# Altium schematic sheet Flash_memory.SchDoc: =DT_SCH_Title
size A3; Organization: Droid Technologies; SheetNumber: 6; SheetTotal: 22
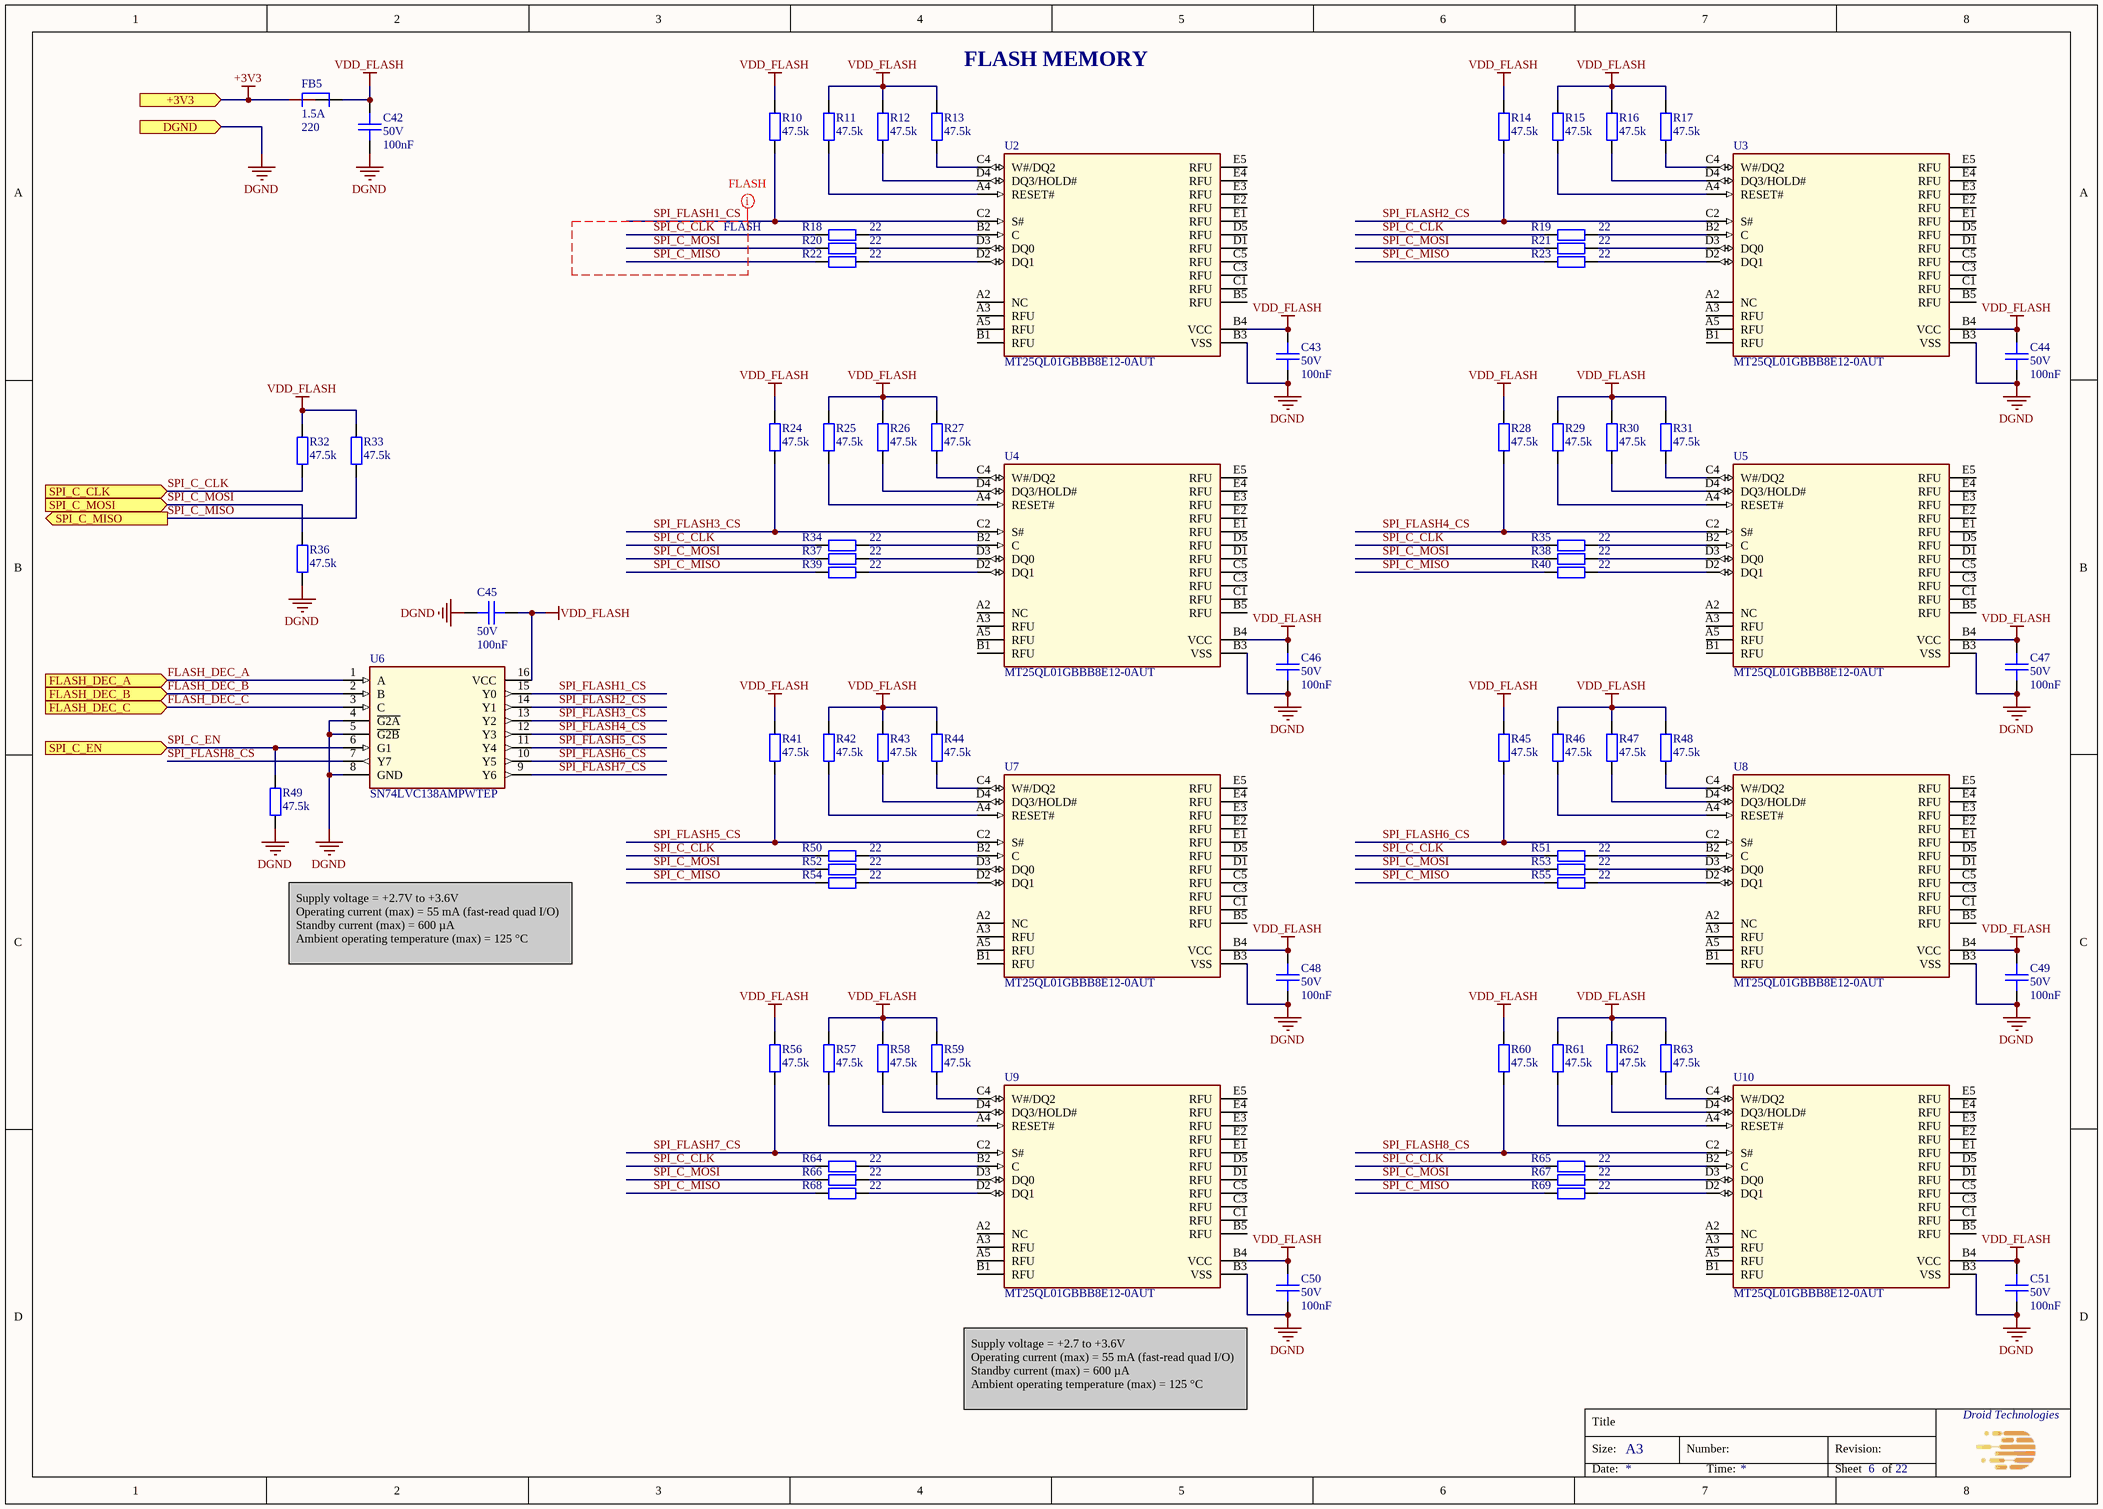
[diagram p0: Flash_memory.SchDoc]

## Parts
C42  Voltage Rating: 50V  Capacitance: 100nF  [CAPC100x50x50L25]  (hidden comment: GCM155L8EH104KE07D)
C43  Voltage Rating: 50V  Capacitance: 100nF  [CAPC100x50x50L25]  (hidden comment: GCM155L8EH104KE07D)
C44  Voltage Rating: 50V  Capacitance: 100nF  [CAPC100x50x50L25]  (hidden comment: GCM155L8EH104KE07D)
C45  Voltage Rating: 50V  Capacitance: 100nF  [CAPC100x50x50L25]  (hidden comment: GCM155L8EH104KE07D)
C46  Voltage Rating: 50V  Capacitance: 100nF  [CAPC100x50x50L25]  (hidden comment: GCM155L8EH104KE07D)
C47  Voltage Rating: 50V  Capacitance: 100nF  [CAPC100x50x50L25]  (hidden comment: GCM155L8EH104KE07D)
C48  Voltage Rating: 50V  Capacitance: 100nF  [CAPC100x50x50L25]  (hidden comment: GCM155L8EH104KE07D)
C49  Voltage Rating: 50V  Capacitance: 100nF  [CAPC100x50x50L25]  (hidden comment: GCM155L8EH104KE07D)
C50  Voltage Rating: 50V  Capacitance: 100nF  [CAPC100x50x50L25]  (hidden comment: GCM155L8EH104KE07D)
C51  Voltage Rating: 50V  Capacitance: 100nF  [CAPC100x50x50L25]  (hidden comment: GCM155L8EH104KE07D)
FB5  Imax: 1.5A  Impedance: 220  [BEADC160X80X95L40]  (hidden comment: BLM18KG221BH1D)
R10  Resistance: 47.5k  [RESC100X50X40L25]  (hidden comment: RC0402FR-0747K5L)
R11  Resistance: 47.5k  [RESC100X50X40L25]  (hidden comment: RC0402FR-0747K5L)
R12  Resistance: 47.5k  [RESC100X50X40L25]  (hidden comment: RC0402FR-0747K5L)
R13  Resistance: 47.5k  [RESC100X50X40L25]  (hidden comment: RC0402FR-0747K5L)
R14  Resistance: 47.5k  [RESC100X50X40L25]  (hidden comment: RC0402FR-0747K5L)
R15  Resistance: 47.5k  [RESC100X50X40L25]  (hidden comment: RC0402FR-0747K5L)
R16  Resistance: 47.5k  [RESC100X50X40L25]  (hidden comment: RC0402FR-0747K5L)
R17  Resistance: 47.5k  [RESC100X50X40L25]  (hidden comment: RC0402FR-0747K5L)
R18  Resistance: 22  [RESC100X50X40L25]  (hidden comment: RC0402FR-0722RL)
R19  Resistance: 22  [RESC100X50X40L25]  (hidden comment: RC0402FR-0722RL)
R20  Resistance: 22  [RESC100X50X40L25]  (hidden comment: RC0402FR-0722RL)
R21  Resistance: 22  [RESC100X50X40L25]  (hidden comment: RC0402FR-0722RL)
R22  Resistance: 22  [RESC100X50X40L25]  (hidden comment: RC0402FR-0722RL)
R23  Resistance: 22  [RESC100X50X40L25]  (hidden comment: RC0402FR-0722RL)
R24  Resistance: 47.5k  [RESC100X50X40L25]  (hidden comment: RC0402FR-0747K5L)
R25  Resistance: 47.5k  [RESC100X50X40L25]  (hidden comment: RC0402FR-0747K5L)
R26  Resistance: 47.5k  [RESC100X50X40L25]  (hidden comment: RC0402FR-0747K5L)
R27  Resistance: 47.5k  [RESC100X50X40L25]  (hidden comment: RC0402FR-0747K5L)
R28  Resistance: 47.5k  [RESC100X50X40L25]  (hidden comment: RC0402FR-0747K5L)
R29  Resistance: 47.5k  [RESC100X50X40L25]  (hidden comment: RC0402FR-0747K5L)
R30  Resistance: 47.5k  [RESC100X50X40L25]  (hidden comment: RC0402FR-0747K5L)
R31  Resistance: 47.5k  [RESC100X50X40L25]  (hidden comment: RC0402FR-0747K5L)
R32  Resistance: 47.5k  [RESC100X50X40L25]  (hidden comment: RC0402FR-0747K5L)
R33  Resistance: 47.5k  [RESC100X50X40L25]  (hidden comment: RC0402FR-0747K5L)
R34  Resistance: 22  [RESC100X50X40L25]  (hidden comment: RC0402FR-0722RL)
R35  Resistance: 22  [RESC100X50X40L25]  (hidden comment: RC0402FR-0722RL)
R36  Resistance: 47.5k  [RESC100X50X40L25]  (hidden comment: RC0402FR-0747K5L)
R37  Resistance: 22  [RESC100X50X40L25]  (hidden comment: RC0402FR-0722RL)
R38  Resistance: 22  [RESC100X50X40L25]  (hidden comment: RC0402FR-0722RL)
R39  Resistance: 22  [RESC100X50X40L25]  (hidden comment: RC0402FR-0722RL)
R40  Resistance: 22  [RESC100X50X40L25]  (hidden comment: RC0402FR-0722RL)
R41  Resistance: 47.5k  [RESC100X50X40L25]  (hidden comment: RC0402FR-0747K5L)
R42  Resistance: 47.5k  [RESC100X50X40L25]  (hidden comment: RC0402FR-0747K5L)
R43  Resistance: 47.5k  [RESC100X50X40L25]  (hidden comment: RC0402FR-0747K5L)
R44  Resistance: 47.5k  [RESC100X50X40L25]  (hidden comment: RC0402FR-0747K5L)
R45  Resistance: 47.5k  [RESC100X50X40L25]  (hidden comment: RC0402FR-0747K5L)
R46  Resistance: 47.5k  [RESC100X50X40L25]  (hidden comment: RC0402FR-0747K5L)
R47  Resistance: 47.5k  [RESC100X50X40L25]  (hidden comment: RC0402FR-0747K5L)
R48  Resistance: 47.5k  [RESC100X50X40L25]  (hidden comment: RC0402FR-0747K5L)
R49  Resistance: 47.5k  [RESC100X50X40L25]  (hidden comment: RC0402FR-0747K5L)
R50  Resistance: 22  [RESC100X50X40L25]  (hidden comment: RC0402FR-0722RL)
R51  Resistance: 22  [RESC100X50X40L25]  (hidden comment: RC0402FR-0722RL)
R52  Resistance: 22  [RESC100X50X40L25]  (hidden comment: RC0402FR-0722RL)
R53  Resistance: 22  [RESC100X50X40L25]  (hidden comment: RC0402FR-0722RL)
R54  Resistance: 22  [RESC100X50X40L25]  (hidden comment: RC0402FR-0722RL)
R55  Resistance: 22  [RESC100X50X40L25]  (hidden comment: RC0402FR-0722RL)
R56  Resistance: 47.5k  [RESC100X50X40L25]  (hidden comment: RC0402FR-0747K5L)
R57  Resistance: 47.5k  [RESC100X50X40L25]  (hidden comment: RC0402FR-0747K5L)
R58  Resistance: 47.5k  [RESC100X50X40L25]  (hidden comment: RC0402FR-0747K5L)
R59  Resistance: 47.5k  [RESC100X50X40L25]  (hidden comment: RC0402FR-0747K5L)
R60  Resistance: 47.5k  [RESC100X50X40L25]  (hidden comment: RC0402FR-0747K5L)
R61  Resistance: 47.5k  [RESC100X50X40L25]  (hidden comment: RC0402FR-0747K5L)
R62  Resistance: 47.5k  [RESC100X50X40L25]  (hidden comment: RC0402FR-0747K5L)
R63  Resistance: 47.5k  [RESC100X50X40L25]  (hidden comment: RC0402FR-0747K5L)
R64  Resistance: 22  [RESC100X50X40L25]  (hidden comment: RC0402FR-0722RL)
R65  Resistance: 22  [RESC100X50X40L25]  (hidden comment: RC0402FR-0722RL)
R66  Resistance: 22  [RESC100X50X40L25]  (hidden comment: RC0402FR-0722RL)
R67  Resistance: 22  [RESC100X50X40L25]  (hidden comment: RC0402FR-0722RL)
R68  Resistance: 22  [RESC100X50X40L25]  (hidden comment: RC0402FR-0722RL)
R69  Resistance: 22  [RESC100X50X40L25]  (hidden comment: RC0402FR-0722RL)
U2  MT25QL01GBBB8E12-0AUT  [24-T-PBGA (6x8)]
U3  MT25QL01GBBB8E12-0AUT  [24-T-PBGA (6x8)]
U4  MT25QL01GBBB8E12-0AUT  [24-T-PBGA (6x8)]
U5  MT25QL01GBBB8E12-0AUT  [24-T-PBGA (6x8)]
U6  SN74LVC138AMPWTEP  [TSSOP16]
U7  MT25QL01GBBB8E12-0AUT  [24-T-PBGA (6x8)]
U8  MT25QL01GBBB8E12-0AUT  [24-T-PBGA (6x8)]
U9  MT25QL01GBBB8E12-0AUT  [24-T-PBGA (6x8)]
U10  MT25QL01GBBB8E12-0AUT  [24-T-PBGA (6x8)]

## Ports
+3V3 (in), DGND (in), FLASH_DEC_A (in), FLASH_DEC_B (in), FLASH_DEC_C (in), SPI_C_CLK (in), SPI_C_EN (in), SPI_C_MISO (out), SPI_C_MOSI (in)

## Nets
+3V3: FB5.1 ; port +3V3
DGND: C42.1 C43.1 C44.1 C45.1 C46.1 C47.1 C48.1 C49.1 C50.1 C51.1 R36.1 R49.1 U2.B3(VSS) U3.B3(VSS) U4.B3(VSS) U5.B3(VSS) U6.4(~{G2A}) U6.5(~{G2B}) U6.8(GND) U7.B3(VSS) U8.B3(VSS) U9.B3(VSS) U10.B3(VSS) ; port DGND
VDD_FLASH: C42.2 C43.2 C44.2 C45.2 C46.2 C47.2 C48.2 C49.2 C50.2 C51.2 FB5.2 R10.2 R11.2 R12.2 R13.2 R14.2 R15.2 R16.2 R17.2 R24.2 R25.2 R26.2 R27.2 R28.2 R29.2 R30.2 R31.2 R32.2 R33.2 R41.2 R42.2 R43.2 R44.2 R45.2 R46.2 R47.2 R48.2 R56.2 R57.2 R58.2 R59.2 R60.2 R61.2 R62.2 R63.2 U2.B4(VCC) U3.B4(VCC) U4.B4(VCC) U5.B4(VCC) U6.16(VCC) U7.B4(VCC) U8.B4(VCC) U9.B4(VCC) U10.B4(VCC)
FLASH_DEC_A: U6.1(A) ; port FLASH_DEC_A
FLASH_DEC_B: U6.2(B) ; port FLASH_DEC_B
FLASH_DEC_C: U6.3(C) ; port FLASH_DEC_C
SPI_C_CLK: R18.1 R19.1 R32.1 R34.1 R35.1 R50.1 R51.1 R64.1 R65.1 ; port SPI_C_CLK
SPI_C_EN: R49.2 U6.6(G1) ; port SPI_C_EN
SPI_C_MISO: R22.1 R23.1 R33.1 R39.1 R40.1 R54.1 R55.1 R68.1 R69.1 ; port SPI_C_MISO
SPI_C_MOSI: R20.1 R21.1 R36.2 R37.1 R38.1 R52.1 R53.1 R66.1 R67.1 ; port SPI_C_MOSI
SPI_FLASH1_CS: R10.1 U2.C2(S#) U6.15(Y0)
SPI_FLASH2_CS: R14.1 U3.C2(S#) U6.14(Y1)
SPI_FLASH3_CS: R24.1 U4.C2(S#) U6.13(Y2)
SPI_FLASH4_CS: R28.1 U5.C2(S#) U6.12(Y3)
SPI_FLASH5_CS: R41.1 U6.11(Y4) U7.C2(S#)
SPI_FLASH6_CS: R45.1 U6.10(Y5) U8.C2(S#)
SPI_FLASH7_CS: R56.1 U6.9(Y6) U9.C2(S#)
SPI_FLASH8_CS: R60.1 U6.7(Y7) U10.C2(S#)
NetR11_1: R11.1 U2.A4(RESET#)
NetR12_1: R12.1 U2.D4(DQ3/HOLD#)
NetR13_1: R13.1 U2.C4(W#/DQ2)
NetR15_1: R15.1 U3.A4(RESET#)
NetR16_1: R16.1 U3.D4(DQ3/HOLD#)
NetR17_1: R17.1 U3.C4(W#/DQ2)
NetR18_2: R18.2 U2.B2(C)
NetR19_2: R19.2 U3.B2(C)
NetR20_2: R20.2 U2.D3(DQ0)
NetR21_2: R21.2 U3.D3(DQ0)
NetR22_2: R22.2 U2.D2(DQ1)
NetR23_2: R23.2 U3.D2(DQ1)
NetR25_1: R25.1 U4.A4(RESET#)
NetR26_1: R26.1 U4.D4(DQ3/HOLD#)
NetR27_1: R27.1 U4.C4(W#/DQ2)
NetR29_1: R29.1 U5.A4(RESET#)
NetR30_1: R30.1 U5.D4(DQ3/HOLD#)
NetR31_1: R31.1 U5.C4(W#/DQ2)
NetR34_2: R34.2 U4.B2(C)
NetR35_2: R35.2 U5.B2(C)
NetR37_2: R37.2 U4.D3(DQ0)
NetR38_2: R38.2 U5.D3(DQ0)
NetR39_2: R39.2 U4.D2(DQ1)
NetR40_2: R40.2 U5.D2(DQ1)
NetR42_1: R42.1 U7.A4(RESET#)
NetR43_1: R43.1 U7.D4(DQ3/HOLD#)
NetR44_1: R44.1 U7.C4(W#/DQ2)
NetR46_1: R46.1 U8.A4(RESET#)
NetR47_1: R47.1 U8.D4(DQ3/HOLD#)
NetR48_1: R48.1 U8.C4(W#/DQ2)
NetR50_2: R50.2 U7.B2(C)
NetR51_2: R51.2 U8.B2(C)
NetR52_2: R52.2 U7.D3(DQ0)
NetR53_2: R53.2 U8.D3(DQ0)
NetR54_2: R54.2 U7.D2(DQ1)
NetR55_2: R55.2 U8.D2(DQ1)
NetR57_1: R57.1 U9.A4(RESET#)
NetR58_1: R58.1 U9.D4(DQ3/HOLD#)
NetR59_1: R59.1 U9.C4(W#/DQ2)
NetR61_1: R61.1 U10.A4(RESET#)
NetR62_1: R62.1 U10.D4(DQ3/HOLD#)
NetR63_1: R63.1 U10.C4(W#/DQ2)
NetR64_2: R64.2 U9.B2(C)
NetR65_2: R65.2 U10.B2(C)
NetR66_2: R66.2 U9.D3(DQ0)
NetR67_2: R67.2 U10.D3(DQ0)
NetR68_2: R68.2 U9.D2(DQ1)
NetR69_2: R69.2 U10.D2(DQ1)

Not connected (* = marked no-connect by the designer): U2 A2(NC) A3(RFU) A5(RFU) B1(RFU) B5(RFU) C1(RFU) C3(RFU) C5(RFU) D1(RFU) D5(RFU) E1(RFU) E2(RFU) E3(RFU) E4(RFU) E5(RFU); U3 A2(NC) A3(RFU) A5(RFU) B1(RFU) B5(RFU) C1(RFU) C3(RFU) C5(RFU) D1(RFU) D5(RFU) E1(RFU) E2(RFU) E3(RFU) E4(RFU) E5(RFU); U4 A2(NC) A3(RFU) A5(RFU) B1(RFU) B5(RFU) C1(RFU) C3(RFU) C5(RFU) D1(RFU) D5(RFU) E1(RFU) E2(RFU) E3(RFU) E4(RFU) E5(RFU); U5 A2(NC) A3(RFU) A5(RFU) B1(RFU) B5(RFU) C1(RFU) C3(RFU) C5(RFU) D1(RFU) D5(RFU) E1(RFU) E2(RFU) E3(RFU) E4(RFU) E5(RFU); U7 A2(NC) A3(RFU) A5(RFU) B1(RFU) B5(RFU) C1(RFU) C3(RFU) C5(RFU) D1(RFU) D5(RFU) E1(RFU) E2(RFU) E3(RFU) E4(RFU) E5(RFU); U8 A2(NC) A3(RFU) A5(RFU) B1(RFU) B5(RFU) C1(RFU) C3(RFU) C5(RFU) D1(RFU) D5(RFU) E1(RFU) E2(RFU) E3(RFU) E4(RFU) E5(RFU); U9 A2(NC) A3(RFU) A5(RFU) B1(RFU) B5(RFU) C1(RFU) C3(RFU) C5(RFU) D1(RFU) D5(RFU) E1(RFU) E2(RFU) E3(RFU) E4(RFU) E5(RFU); U10 A2(NC) A3(RFU) A5(RFU) B1(RFU) B5(RFU) C1(RFU) C3(RFU) C5(RFU) D1(RFU) D5(RFU) E1(RFU) E2(RFU) E3(RFU) E4(RFU) E5(RFU)

## Layout directives
net class FLASH: SPI_FLASH1_CS

## Notes on the sheet
- (near R13) FLASH MEMORY
- Supply voltage = +2.7V to +3.6V
  Operating current (max) = 55 mA (fast-read quad I/O)
  Standby current (max) = 600 µA
  Ambient operating temperature (max) = 125 °C
- Supply voltage = +2.7 to +3.6V
  Operating current (max) = 55 mA (fast-read quad I/O)
  Standby current (max) = 600 µA
  Ambient operating temperature (max) = 125 °C
- Title
- Size:
- A3
- Number:
- Revision:
- Date:
- Time:
- Sheet
- of

## Library data of the parts
C42-C51 = CMP-001-1980-2: CAP CER 0.1UF 50V X8L 0402; Manufacturer: Murata Electronics; Op Temp max: 150°C; Op Temp min: -55°C; Tolerance: 10%; Height max: 550µm; ComponentLink3Description: Digikey; Mounting Type: SM; ComponentLink3URL: https://www.digikey.com/en/products/detail/murata-electronics/GCM155L8EH104KE07D/11618823; Package: 0402 (1005 Metric); Lead Spacing: 0mm; MPN: GCM155L8EH104KE07D; Size: 1.00mm x 0.50mm; Ratings: AEC-Q200; ComponentLink1URL: https://www.murata.com/en-us/products/productdetail?partno=GCM155L8EH104KE07%23; ComponentLink1Description: Datasheet; Dielectric: X8L; ComponentLink2Description: Mouser; ComponentLink2URL: https://eu.mouser.com/ProductDetail/Murata-Electronics/GCM155L8EH104KE07D?qs=1mbolxNpo8fQSHf0HYnZWw%3D%3D
FB5 = CMP-001-1981-1: FERRITE BEAD 220 OHM 0603 1LN; Manufacturer: Murata Electronics; DCR: 50m; Op Temp min: -55°C; Frequency: 100MHz; Op Temp max: 150°C; Number of Lines: 1; Mounting Type: SM; Size: 1.60mm x 0.80mm; ComponentLink2URL: https://eu.mouser.com/ProductDetail/Murata-Electronics/BLM18KG221BH1D?qs=sJ5gq5MLFXpgEHYBdWUtkQ%3D%3D; ComponentLink1Description: Datasheet; ComponentLink1URL: https://www.murata.com/en-us/products/productdata/8798137286686/QNFA9129.pdf; Lead Spacing: 0mm; Ratings: AEC-Q200; ComponentLink3Description: Digikey; ComponentLink3URL: https://www.digikey.com/en/products/detail/murata-electronics/BLM18KG221BH1D/6156000; Height max: 950µm; Package: 0603 (1608 Metric); ComponentLink2Description: Mouser; MPN: BLM18KG221BH1D
R10-R17 R24-R33 R36 R41-R49 R56-R63 = CMP-001-0277-7: RES 47.5K OHM 1% 1/16W 0402; Manufacturer: YAGEO; Op Temp min: -55°C; Power: 63mW; Temperature Coefficient: ±100ppm; Op Temp max: 155°C; ComponentLink1URL: https://www.yageo.com/upload/media/product/productsearch/datasheet/rchip/PYu-RC_Group_51_RoHS_L_12.pdf; ComponentLink1Description: Datasheet; MPN: RC0402FR-0747K5L; ComponentLink3Description: Digikey; ComponentLink2URL: https://eu.mouser.com/ProductDetail/YAGEO/RC0402FR-0747K5L?qs=V1yeUXFNrklfu86Rfgihxg%3D%3D; Mounting Type: SM; Tolerance: 1%; Package: 0402 (1005 Metric); Height max: 400µm; ComponentLink2Description: Mouser; ComponentLink3URL: https://www.digikey.com/en/products/detail/yageo/RC0402FR-0747K5L/726617; Size: 1.00mm x 0.50mm; Composition: Thick Film; Ratings: -
R18-R23 R34 R35 R37-R40 R50-R55 R64-R69 = CMP-001-0482-4: RES 22 OHM 1% 1/16W 0402; Manufacturer: YAGEO; Temperature Coefficient: ±100ppm; Op Temp max: 155°C; Op Temp min: -55°C; Power: 63mW; Ratings: -; ComponentLink3URL: https://www.digikey.com/en/products/detail/yageo/RC0402FR-0722RL/726562; ComponentLink2URL: https://eu.mouser.com/ProductDetail/YAGEO/RC0402FR-0722RL?qs=V1yeUXFNrkkRg6zf08ADKQ%3D%3D; MPN: RC0402FR-0722RL; ComponentLink1Description: Datasheet; ComponentLink3Description: Digikey; Tolerance: 1%; Size: 1.00mm x 0.50mm; ComponentLink1URL: https://www.yageo.com/upload/media/product/productsearch/datasheet/rchip/PYu-RC_Group_51_RoHS_L_12.pdf; Composition: Thick Film; ComponentLink2Description: Mouser; Mounting Type: SM; Package: 0402 (1005 Metric); Height max: 400µm
U2-U5 U7-U10 = MT25QL01GBBB8E12-0AUT: IC FLASH 1GBIT SPI 24TPBGA; Manufacturer: Micron Technology Inc.; MPN: MT25QL01GBBB8E12-0AUT
U6 = SN74LVC138AMPWTEP: IC DECODER/DEMUX 1X3:8 16-TSSOP; Manufacturer: Texas Instruments; MPN: SN74LVC138AMPWTEP